# Altium schematic sheet Guc_Devreleri.SchDoc
size A4; SheetNumber: 3; SheetTotal: 6
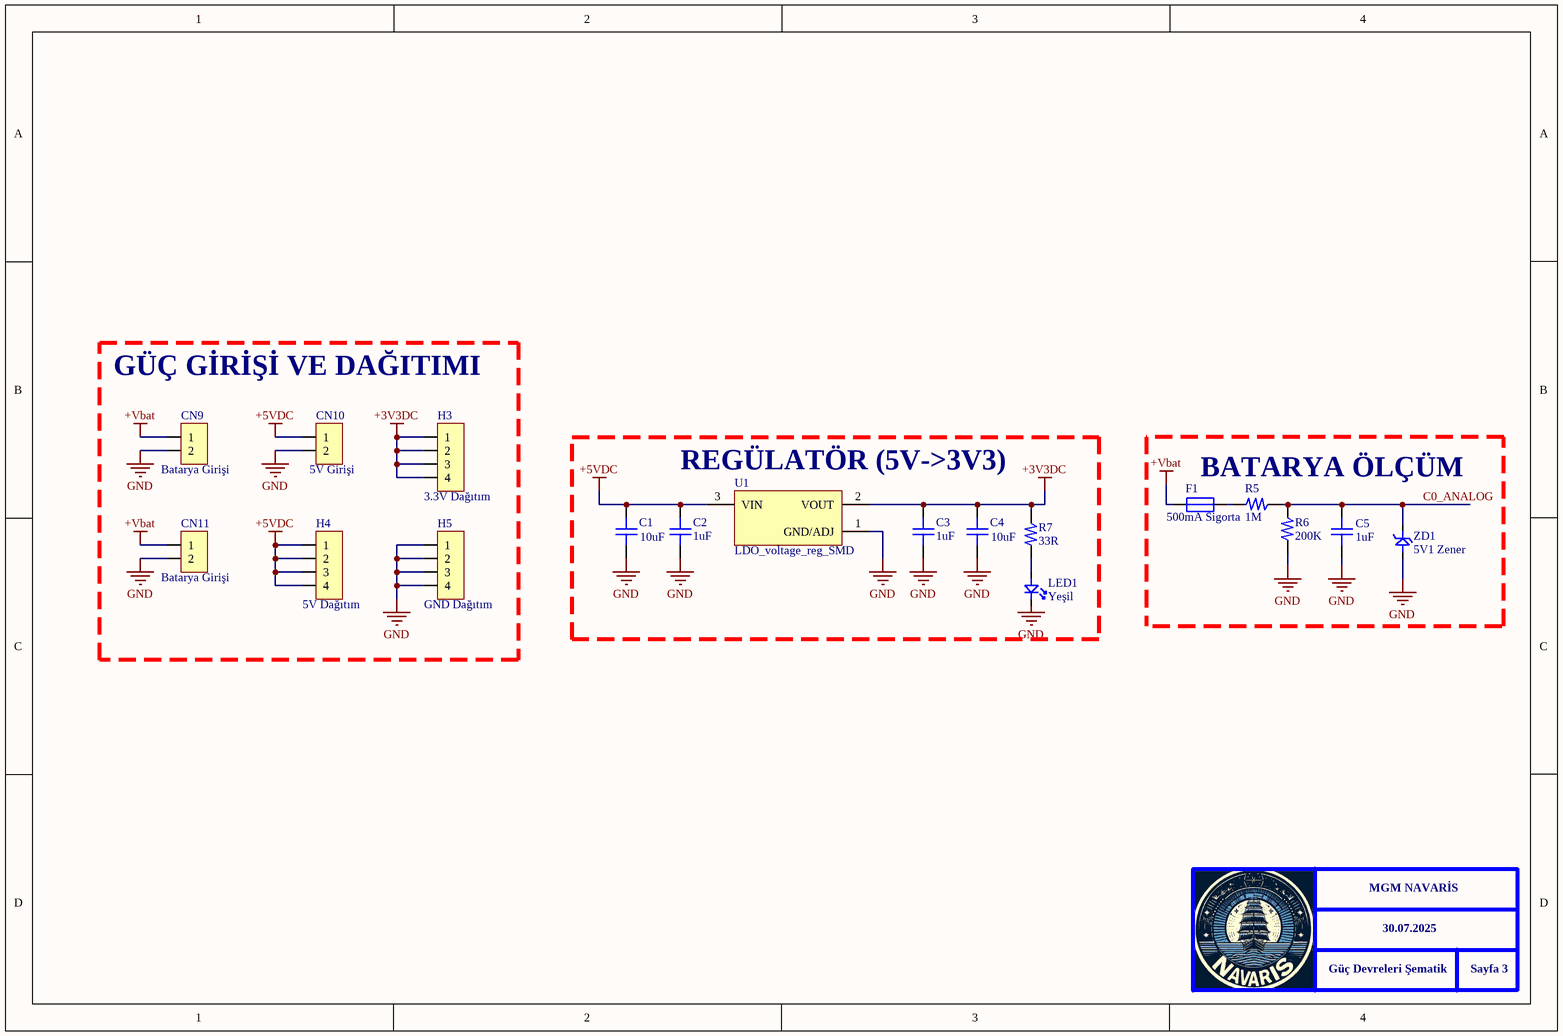
[diagram p0: Guc_Devreleri.SchDoc]

## Parts
C1  10uF  [1206_CAP]
C2  1uF  [1206_CAP]
C3  1uF  [1206_CAP]
C4  10uF  [1206_CAP]
C5  1uF  [1206_CAP]
CN9  Batarya Girişi  [2_Pin_JST_Male]
CN10  5V Girişi  [2_Pin_JST_Male]
CN11  Batarya Girişi  [2_Pin_JST_Male]
F1  500mA Sigorta  [1808_Sigorta]
H3  3.3V Dağıtım  [4_pin_header_2.54mm_FEMALE]
H4  5V Dağıtım  [4_pin_header_2.54mm_FEMALE]
H5  GND Dağıtım  [4_pin_header_2.54mm_FEMALE]
LED1  Yeşil  [1206_LED]
R5  1M  [1206_RES]
R6  200K  [1206_RES]
R7  33R  [1206_RES]
U1  LDO_voltage_reg_SMD  [SOT229P700X180-4N]
ZD1  5V1 Zener  [SOD-123]

## Blocks framed on the sheet
REGÜLATÖR (5V->3V3): C1-C4 LED1 R7 U1

## Nets
+3V3DC: C3.2 C4.2 H3.1 H3.2 H3.3 H3.4 R7.2 U1.2(VOUT)
+5VDC: C1.2 C2.2 CN10.1 H4.1 H4.2 H4.3 H4.4 U1.3(VIN)
+Vbat: CN9.1 CN11.1 F1.1
GND: C1.1 C2.1 C3.1 C4.1 C5.1 CN9.2 CN10.2 CN11.2 H5.1 H5.2 H5.3 H5.4 LED1.2 R6.1 U1.1(GND/ADJ) ZD1.1
C0_ANALOG: C5.2 R5.2 R6.2 ZD1.2
NetF1_2: F1.2 R5.1
NetLED1_1: LED1.1 R7.1

## Notes on the sheet
- GÜÇ GİRİŞİ VE DAĞITIMI
- BATARYA ÖLÇÜM
- MGM NAVARİS
- Güç Devreleri Şematik
- 30.07.2025
- Sayfa 3

## Library data of the parts
C1-C5 = 1206_CAP
CN9-CN11 = 2_Pin_JST_Male
F1 = 1808_Sigorta
H3-H5 = 4_pin_header_female
LED1 = 1206_LED
R5-R7 = 1206_RES
U1 = AMS1117-3.3: Sot223/Pkg 1-Amp 3.3-Volt Low Drop Out Voltage Regulatator; MF: Advanced Monolithic Systems; Value: 3.3V_DC; Package: SOT-223 Seeed Technology; Check_prices: https://www.snapeda.com/parts/AMS1117-3.3/Advanced+Monolithic+Systems/view-part/?ref=eda; Price: None; Availability: Not in stock; MP: AMS1117-3.3; SnapEDA_Link: https://www.snapeda.com/parts/AMS1117-3.3/Advanced+Monolithic+Systems/view-part/?ref=snap; LCSC Part Number: C20611856
ZD1 = SMD_Zener_Diyot